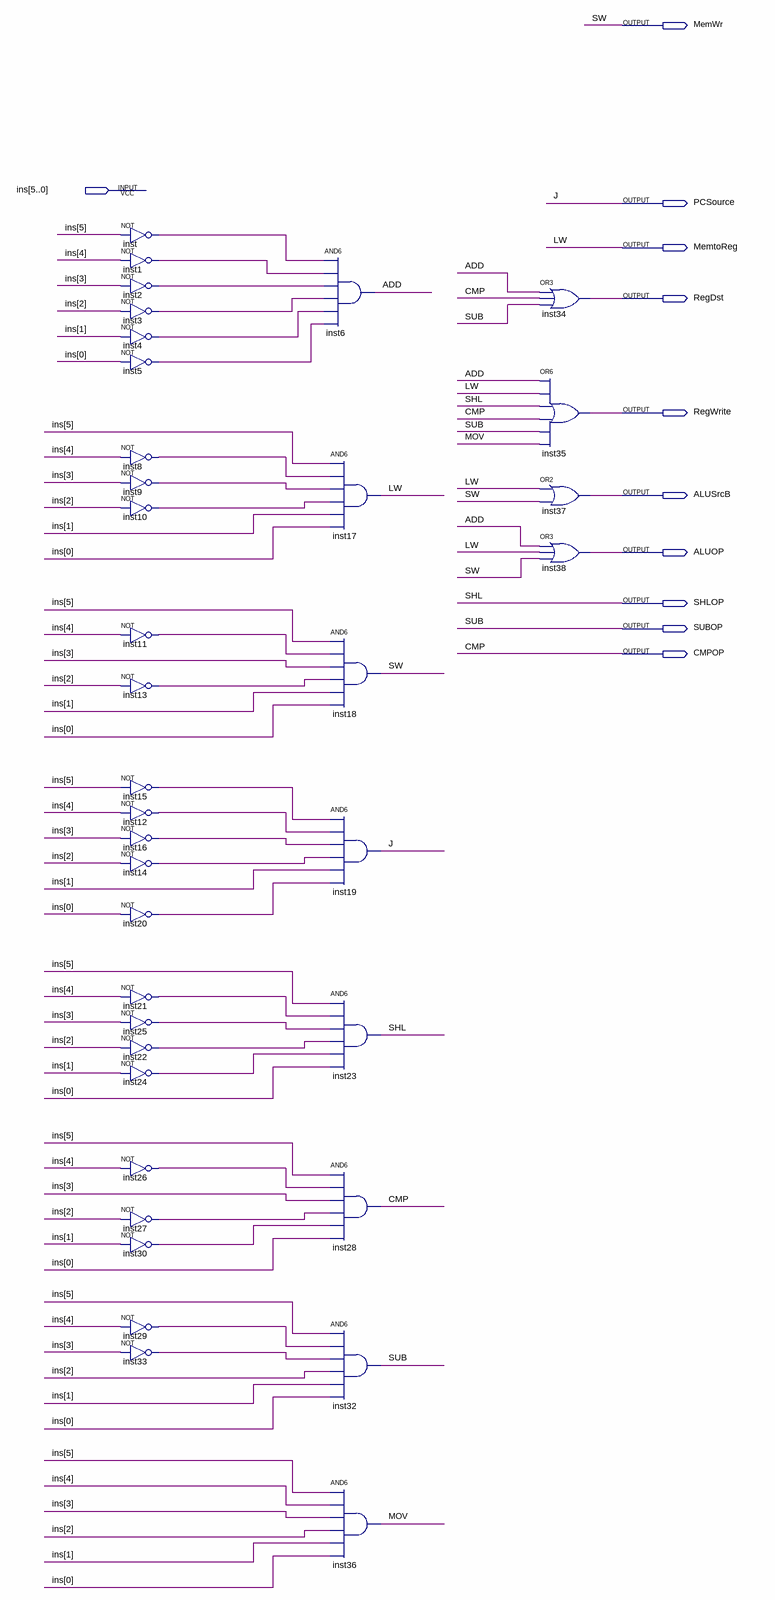
[diagram p0: schematic sheet]
// Quartus schematic controller.bdf as structural Verilog: 37 symbols, 11 pins
module controller (
  input  [5:0] ins,
  output MemWr,
  output PCSource,
  output MemtoReg,
  output RegDst,
  output RegWrite,
  output ALUSrcB,
  output ALUOP,
  output SHLOP,
  output SUBOP,
  output CMPOP
);

  wire ADD, inst1_out, inst2_out, inst3_out, inst4_out, inst5_out, inst8_out, inst9_out, inst10_out,
       inst11_out, inst12_out, inst13_out, inst14_out, inst15_out, inst16_out, inst20_out, inst21_out,
       inst22_out, inst24_out, inst25_out, inst26_out, inst27_out, inst29_out, inst30_out, inst33_out,
       inst_out, MOV;

  not inst (inst_out, ins[5]);
  not inst1 (inst1_out, ins[4]);
  not inst2 (inst2_out, ins[3]);
  not inst3 (inst3_out, ins[2]);
  not inst4 (inst4_out, ins[1]);
  not inst5 (inst5_out, ins[0]);
  not inst8 (inst8_out, ins[4]);
  not inst9 (inst9_out, ins[3]);
  not inst10 (inst10_out, ins[2]);
  not inst11 (inst11_out, ins[4]);
  not inst13 (inst13_out, ins[2]);
  not inst15 (inst15_out, ins[5]);
  not inst12 (inst12_out, ins[4]);
  not inst16 (inst16_out, ins[3]);
  not inst14 (inst14_out, ins[2]);
  not inst20 (inst20_out, ins[0]);
  not inst21 (inst21_out, ins[4]);
  not inst25 (inst25_out, ins[3]);
  not inst22 (inst22_out, ins[2]);
  not inst24 (inst24_out, ins[1]);
  not inst26 (inst26_out, ins[4]);
  not inst27 (inst27_out, ins[2]);
  not inst30 (inst30_out, ins[1]);
  not inst29 (inst29_out, ins[4]);
  not inst33 (inst33_out, ins[3]);
  and inst6 (ADD, inst_out, inst1_out, inst2_out, inst3_out, inst4_out, inst5_out);
  and inst17 (MemtoReg, ins[5], inst8_out, inst9_out, inst10_out, ins[1], ins[0]);
  and inst18 (MemWr, ins[5], inst11_out, ins[3], inst13_out, ins[1], ins[0]);
  and inst19 (PCSource, inst15_out, inst12_out, inst16_out, inst14_out, ins[1], inst20_out);
  and inst23 (SHLOP, ins[5], inst21_out, inst25_out, inst22_out, inst24_out, ins[0]);
  and inst28 (CMPOP, ins[5], inst26_out, ins[3], inst27_out, inst30_out, ins[0]);
  and inst32 (SUBOP, ins[5], inst29_out, inst33_out, ins[2], ins[1], ins[0]);
  and inst36 (MOV, ins[5], ins[4], ins[3], ins[2], ins[1], ins[0]);
  or inst34 (RegDst, ADD, CMPOP, SUBOP);
  or inst35 (RegWrite, ADD, MemtoReg, SHLOP, CMPOP, SUBOP, MOV);
  or inst37 (ALUSrcB, MemtoReg, MemWr);
  or inst38 (ALUOP, ADD, MemtoReg, MemWr);

  // Other names for the same wires on the sheet: CMP = CMPOP; J = PCSource; LW = MemtoReg; SHL = SHLOP; SUB = SUBOP;
  //   SW = MemWr
endmodule
